# EasyEDA Pro project V2_compatibility_export_as_received.epro, board ESP32P4_Prototype_V2.3b6
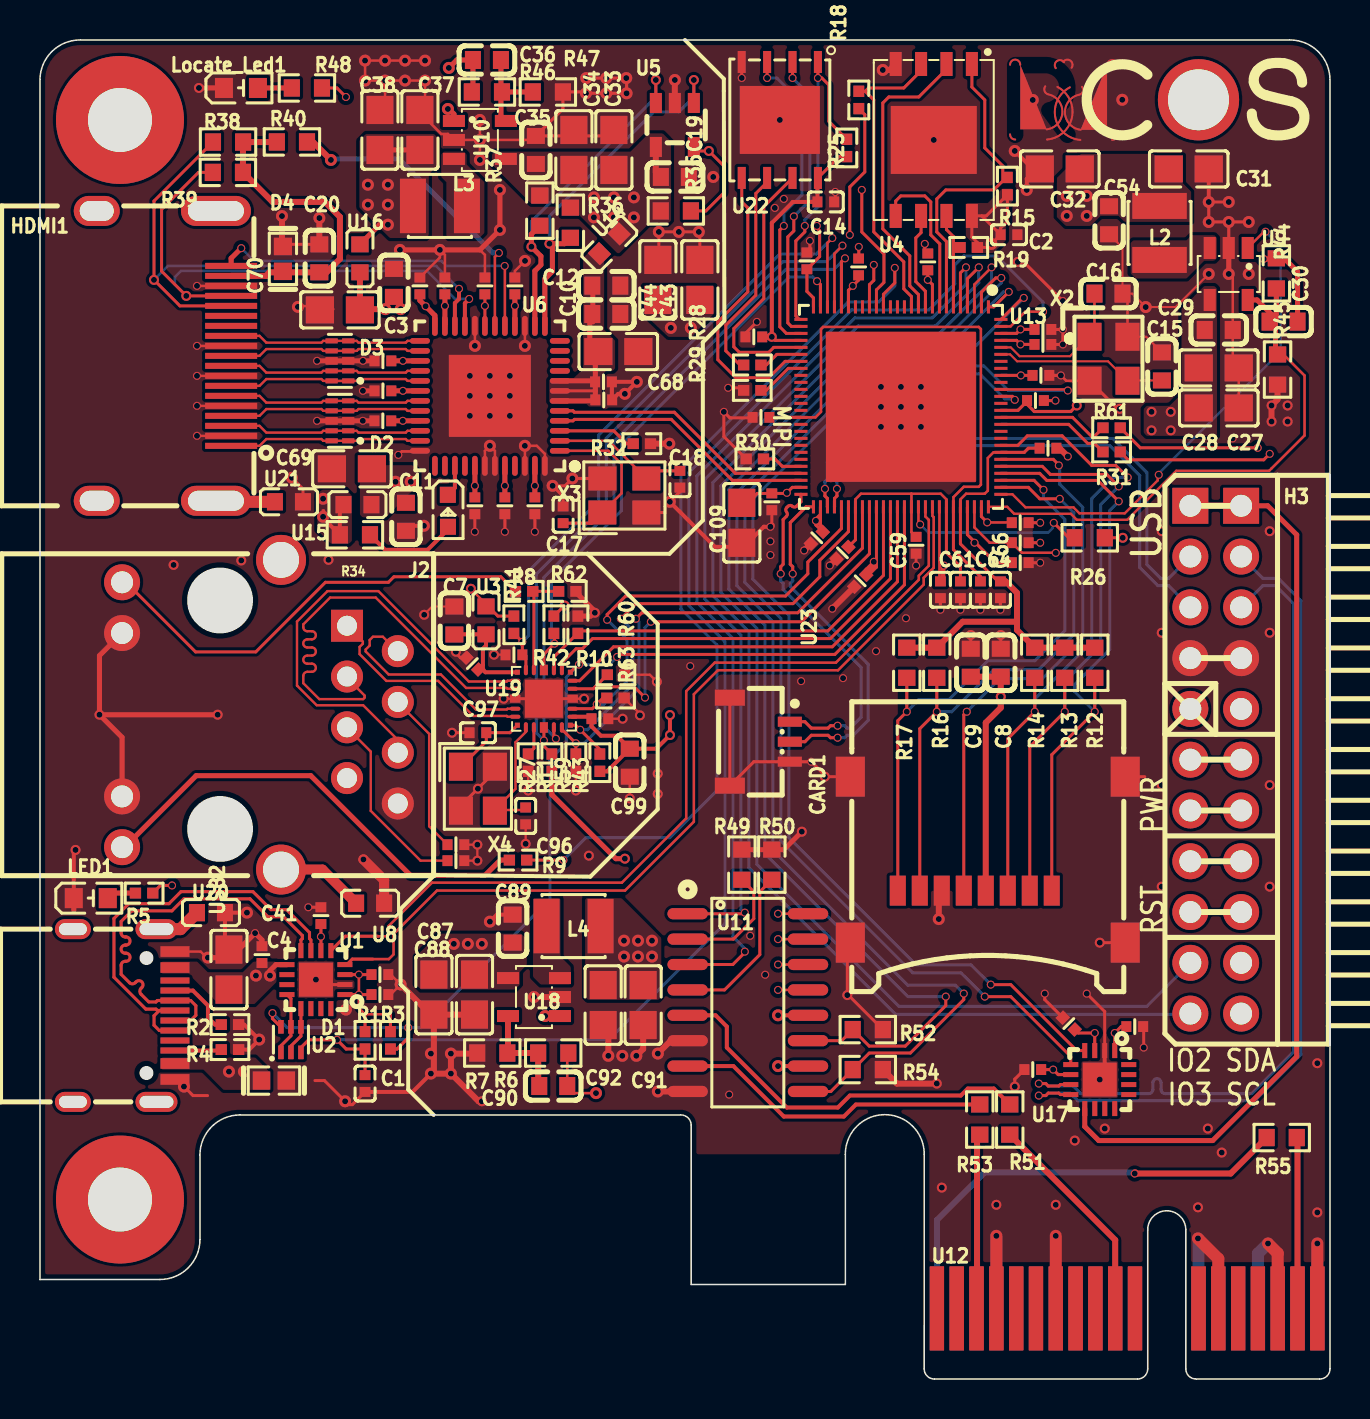
[diagram p8: board, top side]
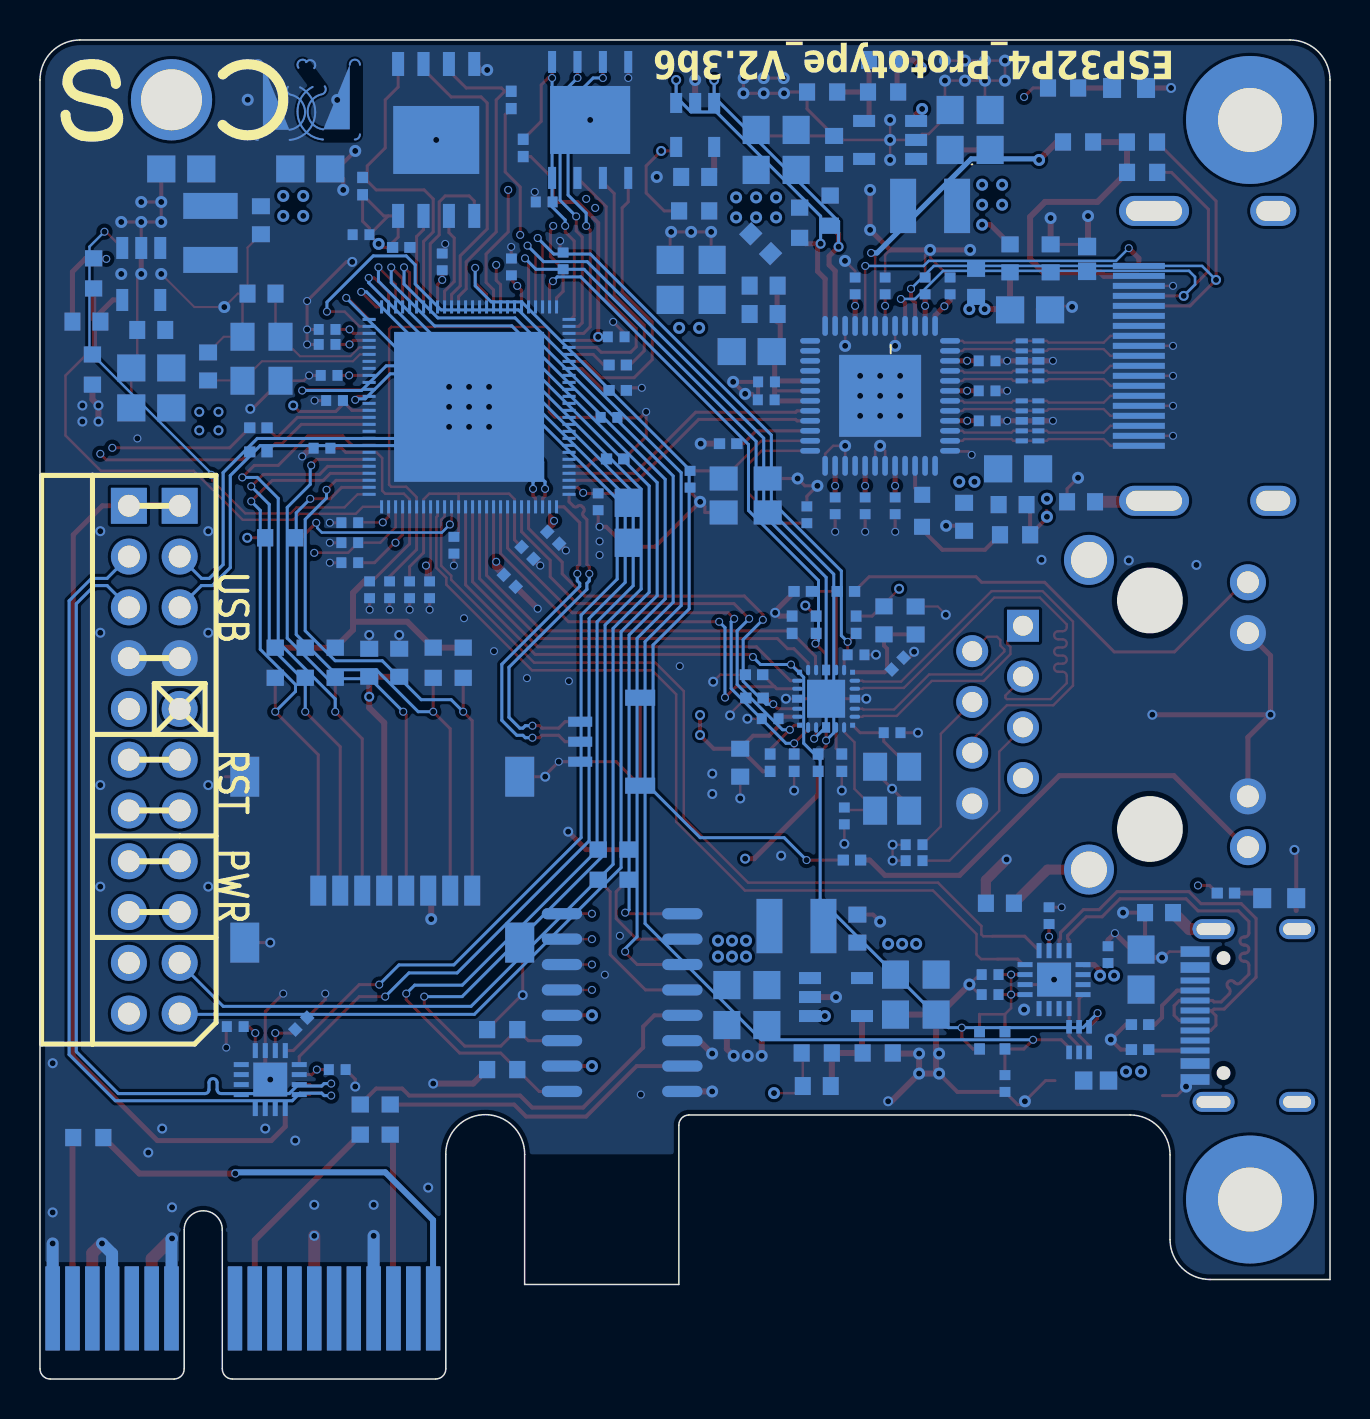
[diagram p9: board, bottom side, seen from below]

Outline 64.52 x 66.98 mm; copper layers: Top Layer, GND, VCC, VCC1, GND1, Bottom Layer. Coordinates in mm from the lower left corner of the outline.
Outline path: 0,64.98 arc(0.59,66.39) 2,66.98 62.52,66.98 arc(63.93,66.39) 64.52,64.98 64.52,0.51 arc(64.37,0.15) 64.01,0 57.81,0 arc(57.45,0.15) 57.3,0.51 57.3,7.46 arc(56.35,8.41) 55.4,7.46 55.4,0.51 arc(55.25,0.15) 54.89,0 44.73,0 arc(44.37,0.15) 44.22,0.51 44.22,11.24 arc(42.25,13.21) 40.28,11.24 40.28,4.73 32.57,4.73 32.57,12.7 arc(32.42,13.06) 32.06,13.21 10,13.21 arc(8.59,12.62) 8,11.21 8,6.98 arc(7.41,5.56) 6,4.98 0,4.98 0,64.98
Stack: Top Layer 0.035mm Outer layer thickness 1oz / Dielectric1 0.0994mm 3313 RC57% 4.2mil / GND 0.035mm / Dielectric2 0.55mm 0.55mm H/H No copper / VCC 0.035mm / Dielectric3 0.1088mm 2116 RC54% 4.9mil / VCC1 0.0152mm Inner layer thickness / Dielectric4 0.55mm 0.55mm H/H No copper / GND1 0.0152mm Inner layer thickness / Dielectric5 0.0994mm 3313 RC57% 4.2mil / Bottom Layer 0.035mm Outer layer thickness 1oz

## Design rules (mm)
net HDMI_2P+: DP4
net HDMI_2N-: DP4
net HDMI_1P+: DP3
net HDMI_1N-: DP3
net HDMI_0P+: DP2
net HDMI_0N-: DP2
net HDMI_CP+: DP1
net HDMI_CN-: DP1
net REFCLK+: DP22
net REFCLK-: DP22
net PERN0: DP20
net PERP0: DP20
net PETP0: DP23
net PETN0: DP23
net CH343P0_USB_D+: DP16
net CH343P0_USB_D-: DP16
net DM_MS: DP17
net DP_MS: DP17
net TD+: DP26
net TD-: DP26
net RD+: DP25
net RD-: DP25
net DM_HID: DP18
net DP_HID: DP18
net USB2_D+: DP24
net USB2_D-: DP24
net USB1P1_N0: DP27
net USB1P1_P0: DP27
spacing copperThickness1oz (default): track to track 0.102, other pairs 0.102 to 0.3
spacing copperThickness2oz: track to track 0.203, other pairs 0.152 to 0.3
spacing copperThicknessInner0.5oz: track to track 0.089, other pairs 0.152 to 0.3
spacing Plane_innerPlane: track to track 0.102, other pairs 0.152 to 0.3
spacing Copper_1: track to track 0.102, other pairs 0.152 to 0.3
spacing Copper_copperRegion: track to track 0.102, other pairs 0.152 to 0.3
track width copperThickness1oz (default): min 0.102, default 0.254, max 2.54
track width copperThickness2oz: min 0.203, default 0.254, max 2.54
track width copperThickness0.5oz: min 0.089, default 0.254, max 2.54
differential pair differentialPair (default): width min 0.102, default 0.119, max 0.254; gap min 0.152, default 0.203
net GND uses copperRegion
net 5V_SYS uses copperRegion
net 3V3_SYS uses copperRegion
net USB3V3_MS uses copperRegion
net VCC_HP uses copperRegion
net P4_VDDO4_SDIO uses copperRegion
net $6N85 uses copperRegion

## Placement (name value [footprint] x y rotation side)
C1  1uF  [C0402]  16.26 14.78 90 top
C2  100nF  [C0402]  48.46 57.24 0 top
C3  10uf  [C0603]  17.7 54.83 270 top
C4  4.7uF  [C0805]  9.45 20.48 90 top
C5  100nF  [C0402 去耦电容]  20.8 25.93 180 top
C6  100nF  [C0402 去耦电容]  20.8 26.73 180 top
C7  1uF  [C0603]  20.72 37.94 270 top
C8  100nF  [C0603]  48.05 35.83 270 top
C9  10uF  [C0603]  46.55 35.83 270 top
C10  10uf  [C0603]  28.32 53.27 180 top
C11  10uf  [C0603]  18.3 43.13 90 top
C12  10uf  [C0603]  28.32 54.69 180 top
C14  100nF  [C0402]  39.3 58.88 0 top
C15  20pF  [C0603]  56.11 50.65 90 top
C16  20pF  [C0603]  53.44 54.29 180 top
C17  12pF  [C0402]  26.16 43.23 90 top
C18  12pF  [C0402]  32 45.01 270 top
C19  100nF  [C0603]  31.75 60.13 180 top
C20  100nF  [C0603]  13.97 56.06 270 top
C27  22uF  [C0805]  58.95 48.57 180 top
C28  22uF  [C0805]  58.95 50.57 180 top
C29  100nF  [C0603]  58.95 52.47 180 top
C30  22pF  [C0603]  62.19 52.89 0 top
C31  10uF  [C0805]  57.45 60.53 180 top
C32  10uF  [C0805]  51 60.53 0 top
C33  22uF  [C0805]  28.7 61.48 270 top
C34  22uF  [C0805]  26.7 61.48 270 top
C35  100nF  [C0603]  24.8 61.48 270 top
C36  22pF  [C0603]  22.35 65.98 180 top
C37  10uF  [C0805]  19 62.48 270 top
C38  10uF  [C0805]  17 62.48 270 top
C39  100nF  [C0402 去耦电容]  14.05 23.18 270 top
C40  100nF  [C0402 去耦电容]  17 20.23 180 top
C41  100nF  [C0402 去耦电容]  11.1 21.23 270 top
C42  100nF  [C0402 去耦电容]  17 19.23 180 top
C43  10uF  [C0805]  33 54.98 270 top
C44  10uF  [C0805]  30.9 54.98 270 top
C45  100nF  [C0402 去耦电容]  40.94 55.63 270 top
C46  100nF  [C0402 去耦电容]  44.4 55.88 270 top
C47  100nF  [C0402 去耦电容]  50.16 52.5 180 top
C48  100nF  [C0402 去耦电容]  49.02 42.83 180 top
C49  100nF  [C0402 去耦电容]  50.16 51.75 180 top
C50  100nF  [C0402 去耦电容]  50.06 50.2 180 top
C51  100nF  [C0402 去耦电容]  49.02 40.83 180 top
C52  100nF  [C0402 去耦电容]  41.02 39.93 45 top
C53  100nF  [C0402 去耦电容]  36.6 43.88 90 top
C54  10uF  [C0603]  53.47 57.96 90 top
C55  100nF  [C0402 去耦电容]  49.02 41.83 180 top
C56  100nF  [C0402 去耦电容]  49.78 48.94 180 top
C57  100nF  [C0402 去耦电容]  38.35 55.93 270 top
C58  100nF  [C0402 去耦电容]  38.85 42.08 45 top
C59  1uF  [C0402]  45.03 39.48 90 top
C60  100nF  [C0402 去耦电容]  35.7 52.13 0 top
C61  1uF  [C0402]  46.03 39.48 90 top
C62  100nF  [C0402 去耦电容]  40.13 41.32 45 top
C63  100nF  [C0402 去耦电容]  43.82 41.7 90 top
C64  1uF  [C0402]  47.03 39.48 90 top
C65  100nF  [C0402 去耦电容]  36.06 48.1 0 top
C66  10uF  [C0402]  48.03 39.48 90 top
C67  100nF  [C0402 去耦电容]  50.41 46.56 180 top
C68  22uF  [C0805]  28.92 51.39 180 top
C69  22uF  [C0805]  15.6 45.53 0 top
C70  22uF  [C0805]  15 53.48 0 top
C71  100nF  [C0402 去耦电容]  28.19 48.98 180 top
C72  100nF  [C0402 去耦电容]  28.18 49.88 180 top
C73  100nF  [C0402 去耦电容]  17.14 47.93 0 top
C74  100nF  [C0402 去耦电容]  17.15 50.93 0 top
C75  100nF  [C0402 去耦电容]  21.75 43.68 90 top
C76  100nF  [C0402 去耦电容]  22.25 54.68 270 top
C77  100nF  [C0402 去耦电容]  19 54.68 270 top
C78  100nF  [C0402 去耦电容]  17.15 49.43 0 top
C79  100nF  [C0402 去耦电容]  24.75 43.68 90 top
C80  100nF  [C0402 去耦电容]  23.25 43.68 90 top
C81  100nF  [C0402 去耦电容]  23.75 54.68 270 top
C82  100nF  [C0402 去耦电容]  20.25 54.68 270 top
C84  100nF  [C0402 去耦电容]  51.45 17.78 315 top
C85  100nF  [C0402 去耦电容]  49.65 15.48 0 top
C86  100nF  [C0402 去耦电容]  54.75 17.63 180 top
C87  4.7uF  [C0805]  19.7 19.23 90 top
C88  2.2uF  [C0805]  21.73 19.23 90 top
C89  100nF  [C0603]  23.64 22.53 270 top
C90  22pF  [C0603]  25.67 14.65 0 top
C91  10uF  [C0805]  28.17 18.7 90 top
C92  10uF  [C0805]  30.17 18.7 90 top
C96  18pF  [C0402]  24.29 28.17 270 top
C97  18pF  [C0402]  21.9 32.33 0 top
C98  100nF  [C0402 去耦电容]  23.7 36.22 0 top
C99  1uF  [C0603]  29.5 30.83 90 top
C100  100nF  [C0402 去耦电容]  21.62 35.79 315 top
C101  100nF  [C0402 去耦电容]  28 33.03 180 top
C109  10uF  [C0805]  35.1 42.83 90 top
CARD1  XKTF-1307-18  [TF-SMD_XKTF-1307-18]  47.4 25.98 0 top
D1  SLPESD0603M05  [D0603-BI]  11.7 14.93 180 top
D2  TPD4E05U06DQAR  [USON-10_L2.5-W1.0-P0.50-BL]  15 47.93 90 top
D3  TPD4E05U06DQAR  [USON-10_L2.5-W1.0-P0.50-BL]  15 50.93 90 top
D4  EZAEG3A50AV  [D0603-BI]  12.15 56.03 270 top
H3  X6521WR-2x11H-C60D30  [HDR-TH_22P-P2.54-H-M-R2-C11-S2.54]  58.8 30.98 90 top
HDMI1  HDMI-001S  [HDMI-SMD_HDMI-001S]  6.2 51.18 270 top
J2  HR911105A  [RJ45-TH_HR911105A]  11 33.23 270 top
L2  2.2uH  [IND-SMD_L3.0-W3.0_FNR30XXS]  55.99 57.33 270 top
L3  2.2uH  [IND-SMD_L3.0-W3.0_FNR30XXS]  20 58.68 0 top
L4  2.2uH  [IND-SMD_L3.0-W3.0_FNR30XXS]  26.68 22.66 180 top
LED1  GL0603UR01  [LED0603-FD]  2.54 24.05 180 top
Locate_Led1  GL0603UR01  [LED0603-FD]  10.05 64.58 180 top
MS_LED1  NCD0603R1  [LED0603-RD_RED]  20.4 43.43 270 top
NOREF  -  [Pad_e360]  57.94 63.99 0 top
NOREF#2  -  [Pad_e359]  4 62.98 0 top
NOREF#3  -  [Pad_e1577]  51.2 63.98 180 top
NOREF#4  -  [Pad_e358]  4 8.98 0 top
NOREF#5  -  [Pad_e1025]  51.2 64 0 top
R1  10kΩ  [R0402]  16.26 16.94 270 top
R2  5.1kΩ  [R0402]  9.5 17.73 180 top
R3  10kΩ  [R0402]  17.53 16.94 270 top
R4  5.1kΩ  [R0402]  9.5 16.48 180 top
R5  4.7k  [R0402]  5.21 24.31 180 top
R6  453kΩ  [R0603]  25.67 16.31 0 top
R7  100kΩ  [R0603]  22.62 16.31 0 top
R8  2.2K  [R0402]  24.21 39.4 180 top
R9  2.2K  [R0402]  23.91 25.96 180 top
R10  2.49kΩ  [R0402]  26.9 37.73 90 top
R11  2.2kΩ  [R0402]  25.6 30.83 270 top
R12  10kΩ  [R0603]  52.75 35.83 270 top
R13  10kΩ  [R0603]  51.25 35.83 270 top
R14  10kΩ  [R0603]  49.75 35.83 270 top
R15  10kΩ  [R0402]  48.38 59.67 90 top
R16  10kΩ  [R0603]  44.85 35.83 270 top
R17  10kΩ  [R0603]  43.35 35.83 270 top
R18  10kΩ  [R0402]  40.95 63.98 90 top
R19  10kΩ  [R0402]  46.45 56.6 0 top
R25  10kΩ  [R0402]  40.35 61.58 90 top
R26  10kΩ  [R0603]  52.5 42.08 0 top
R27  6.49kΩ  [R0402]  24.42 30.83 270 top
R28  22Ω  [R0402]  35.62 50.72 0 top
R29  4.02kΩ  [R0402]  35.62 49.45 0 top
R30  4.02kΩ  [R0402]  35.75 46.02 0 top
R31  0R  [R0402]  53.59 46.37 180 top
R32  4.7kΩ  [R0402]  30.1 46.78 180 top
R34  2.2k  [R0603]  15.75 42.23 180 top
R35  4.7kΩ  [R0603]  31.8 58.43 180 top
R36  4.7kΩ  [R0603]  26.52 57.84 90 top
R37  4.7kΩ  [R0603]  25 58.44 90 top
R38  47kΩ  [R0603]  9.4 61.87 180 top
R39  47kΩ  [R0603]  9.4 60.35 180 top
R40  1kΩ  [R0603]  12.6 61.88 0 top
R41  10kΩ  [R0402]  23.7 37.73 90 top
R42  10kΩ  [R0402]  25.7 37.73 90 top
R43  2.49kΩ  [R0402]  28 30.83 270 top
R44  499kΩ  [R0603]  61.83 55.3 90 top
R45  499kΩ  [R0603]  61.89 50.49 90 top
R46  499kΩ  [R0603]  22.35 64.38 180 top
R47  499kΩ  [R0603]  25.4 64.38 180 top
R48  1kΩ  [R0603]  13.35 64.58 180 top
R49  470Ω  [R0603]  35.1 25.73 270 top
R50  470Ω  [R0603]  36.6 25.73 270 top
R51  470Ω  [R0603]  48.5 12.98 270 top
R52  10kΩ  [R0603]  41.4 17.48 180 top
R53  2.2kΩ  [R0603]  47 12.98 270 top
R54  10kΩ  [R0603]  41.4 15.48 180 top
R55  0  [R0603]  62.1 12.08 0 top
R59  2.49kΩ  [R0402]  26.8 30.83 270 top
R60  2.49kΩ  [R0402]  28.81 35.23 0 top
R61  0R  [R0402]  53.59 47.58 180 top
R62  2.49kΩ  [R0402]  26.37 39.4 0 top
R63  2.49kΩ  [R0402]  28.78 34.06 0 top
U1  CH343P  [TQFN-16_L3.0-W3.0-P0.50-BL-EP1.7]  13.8 19.98 90 top
U2  EMH4T2R  [SOT-563-6_L1.6-W1.2-P0.50-LS1.6-BL]  12.55 16.98 0 top
U3  BLM18PG121SN1D  [L0603]  22.31 37.95 90 top
U4  GD5F2GQ5UEYIGR  [WSON-8_L6.0-W8.0-P1.27-BL-EP]  44.7 61.98 180 top
U5  AT24C16C-STUM-T  [SOT-23-5_L2.9-W1.6-P0.95-LS2.8-BL]  31.75 62.73 180 top
U6  MS2109  [QFN-48_L7.0-W7.0-P0.50-TL-EP4.1]  22.5 49.18 180 top
U8  BLM18PG121SN1D  [L0603]  16.51 23.8 180 top
U9  TLV62569DBVR  [SOT-23-5_L3.0-W1.7-P0.95-LS2.8-BR]  59.45 55.27 90 top
U10  TLV62569DBVR  [SOT-23-5_L3.0-W1.7-P0.95-LS2.8-BR]  22 61.98 180 top
U11  AQS221R2S  [SO-16_L10.3-W4.4-P1.27-LS7.0-BL]  35.4 18.83 270 top
U12  -  [PCIe*1 key]  44.86 3.53 0 top
U13  ESP32-P4NRW32X  [QFN-104_L10.0-W10.0-P0.35-TL-EP7.5]  43.06 48.63 270 top
U14  BLM18PG121SN1D  [L0603]  28.47 56.79 225 top
U15  BLM18PG121SN1D  [L0603]  15.88 43.74 0 top
U16  BLM18PG121SN1D  [L0603]  16 56.06 270 top
U17  CH343P  [TQFN-16_L3.0-W3.0-P0.50-BL-EP1.7]  53 14.98 180 top
U18  TLV62569DBVR  [SOT-23-5_L3.0-W1.7-P0.95-LS2.8-BR]  24.7 19.11 0 top
U19  DP83825IRMQR  [HVQFN-24_L3.0-W3.0-P0.40-TL-EP1.9]  25.2 34.03 270 top
U20  BLM18PG121SN1D  [L0603]  8.55 23.33 180 top
U21  BLM18PG121SN1D  [L0603]  12.45 43.88 180 top
U22  GD25Q128EWIGR  [WSON-8_L6.0-W5.0-P1.27-TL-EP]  37 62.98 270 top
U23  ZX-SH1.0-3PLT  [CONN-SMD_3P-P1.00_HDGC_HDGC1002WV-S-3P]  36 31.88 270 top
USB2  HX TYPE-C 16P L8.35  [USB-C-SMD_HX-TYPE-C-16P-L8.35]  4.2 18.18 270 top
X2  40MHz  [OSC-SMD_4P-L3.2-W2.5-BL_SIT8008BI]  53.44 51.03 270 top
X3  24MHz  [CRYSTAL-SMD_4P-L3.2-W2.5-BL]  29.22 44.19 0 top
X4  25MHz  [CRYSTAL-SMD_4P-L3.2-W2.5-BL]  21.9 29.53 270 top

## Footprints (pads in the part's own frame, mm; a bottom-side part is the same pattern mirrored in y, then rotated)
C0402
  rect 0.5x0.54 hole 0.001: 1(-0.42,0) 2(0.42,0)
C0402 去耦电容
  rect 0.5x0.54 hole 0.001: 1(-0.42,0) 2(0.42,0)
C0603
  rect 0.8x0.9 hole 0.001: 1(-0.7,0) 2(0.7,0)
C0805
  rect 1.41x1.35 hole 0.001: 1(-1,0) 2(1,0)
CONN-SMD_3P-P1.00_HDGC_HDGC1002WV-S-3P
  rect 0.5x1.2 hole 0.001: 1(-1,1.5) 2(0,1.5) 3(1,1.5)
  rect 0.8x1.5 hole 0.001: 4(2.2,-1.5) 5(-2.2,-1.5)
CRYSTAL-SMD_4P-L3.2-W2.5-BL
  rect 1.4x1.2 hole 0.001: 1(-1.1,-0.85) 2(1.1,-0.85) 3(1.1,0.85) 4(-1.1,0.85)
D0603-BI
  rect 0.873x0.907 hole 0.001: 1(-0.622,0) 2(0.622,0)
HDMI-SMD_HDMI-001S
  rect 0.3x2.6 hole 0.001: 1(4.5,3.36) 2(4,3.36) 3(3.5,3.36) 4(3,3.36) 5(2.5,3.36) 6(2,3.36) 7(1.5,3.36) 8(1,3.36) 9(0.5,3.36) 10(0,3.36) 11(-0.5,3.36) 12(-1,3.36) 13(-1.5,3.36) 14(-2,3.36) 15(-2.5,3.36) 16(-3,3.36) 17(-3.5,3.36) 18(-4,3.36) 19(-4.5,3.36)
  oval 1.5x3.5 hole 1x2.8: 20(-7.25,2.6) 21(7.25,2.6)
  oval 1.5x2.3 hole 1x1.7: 22(-7.25,-3.36) 23(7.25,-3.36)
HDR-TH_22P-P2.54-H-M-R2-C11-S2.54
  round 1.8 hole 1.1: 1(-12.7,-1.27) 2(-12.7,1.27) 3(-10.16,-1.27) 4(-10.16,1.27) 5(-7.62,-1.27) 6(-7.62,1.27) 7(-5.08,-1.27) 8(-5.08,1.27) 9(-2.54,-1.27) 10(-2.54,1.27) 11(0,-1.27) 12(0,1.27) 13(2.54,-1.27) 14(2.54,1.27) 15(5.08,-1.27) 16(5.08,1.27) 17(7.62,-1.27) 18(7.62,1.27) 19(10.16,-1.27) 20(10.16,1.27)
  rect 1.8x1.8 hole 1.1: 21(12.7,-1.27) 22(12.7,1.27)
HVQFN-24_L3.0-W3.0-P0.40-TL-EP1.9
  oval 0.525x0.2 hole 0.001: 1(-1.438,0.9) 2(-1.438,0.5) 4(-1.438,-0.5) 5(-1.438,-0.9) 13(1.438,-0.9) 14(1.438,-0.5) 16(1.438,0.5) 17(1.438,0.9)
  rect 0.525x0.4 hole 0.001: 3(-1.438,0) 15(1.438,0)
  rect 0.25x0.25 hole 0.001: 6(-1.325,-1.325) 12(1.325,-1.325) 18(1.325,1.325) 24(-1.325,1.325)
  oval 0.2x0.525 hole 0.001: 7(-0.9,-1.438) 8(-0.5,-1.438) 10(0.5,-1.438) 11(0.9,-1.438) 19(0.9,1.438) 20(0.5,1.438) 22(-0.5,1.438) 23(-0.9,1.438)
  rect 0.4x0.525 hole 0.001: 9(0,-1.438) 21(0,1.438)
  rect 1.9x1.9 hole 0.001: 25(0,0)
IND-SMD_L3.0-W3.0_FNR30XXS
  rect 1.3x2.72 hole 0.001: 1(1.35,0) 2(-1.35,0)
L0603
  rect 0.8x0.864 hole 0.001: 1(-0.7,0) 2(0.7,0)
LED0603-FD
  rect 0.9x1 hole 0.001: 1(-0.85,0) 2(0.85,0)
LED0603-RD_RED
  rect 0.8x0.8 hole 0.001: 1(-0.799,-0.004) 2(0.799,0.004)
OSC-SMD_4P-L3.2-W2.5-BL_SIT8008BI
  rect 1.4x1.2 hole 0.001: 1(-1.1,-0.95) 2(1.1,-0.95) 3(1.1,0.95) 4(-1.1,0.95)
Pad_e358
  round 6.4 hole 3.2: 1(0,0)
Pad_e359
  round 6.4 hole 3.2: 2(0,0)
Pad_e360
  round 4.064 hole 3.048: 1(0,0)
Pad_e1025
  custom 3.124x3.997 hole 0.001: 2(0,0)
Pad_e1577
  custom 3.124x3.996 hole 0.001: 2(0,0)
PCIe*1 key
  custom 0.711x4.191 hole 0.001: A1(0,0) A2(0.991,0) A5(3.962,0) A6(4.953,0) A7(5.944,0) A10(8.915,0) A12(13.081,0) A13(14.072,0) A16(17.044,0) A17(18.034,0) A18(19.024,0) B1(0,0) B2(0.991,0) B5(3.962,0) B6(4.953,0) B7(5.944,0) B10(8.915,0) B12(13.081,0) B13(14.072,0) B16(17.044,0) B17(18.034,0) B18(19.024,0)
  custom 0.712x4.191 hole 0.001: A3(1.981,0) A4(2.972,0) A8(6.934,0) A9(7.925,0) A14(15.062,0) A15(16.053,0) B3(1.981,0) B4(2.972,0) B8(6.934,0) B9(7.925,0) B14(15.062,0) B15(16.053,0)
  rect 0.711x4.191 hole 0.001: A11(9.906,0) B11(9.906,0)
QFN-48_L7.0-W7.0-P0.50-TL-EP4.1
  oval 1x0.28 hole 0.001: 1(-3.5,2.75) 2(-3.5,2.25) 3(-3.5,1.75) 4(-3.5,1.25) 5(-3.5,0.75) 6(-3.5,0.25) 7(-3.5,-0.25) 8(-3.5,-0.75) 9(-3.5,-1.25) 10(-3.5,-1.75) 11(-3.5,-2.25) 12(-3.5,-2.75) 25(3.5,-2.75) 26(3.5,-2.25) 27(3.5,-1.75) 28(3.5,-1.25) 29(3.5,-0.75) 30(3.5,-0.25) 31(3.5,0.25) 32(3.5,0.75) 33(3.5,1.25) 34(3.5,1.75) 35(3.5,2.25) 36(3.5,2.75)
  oval 0.28x1 hole 0.001: 13(-2.75,-3.5) 14(-2.25,-3.5) 15(-1.75,-3.5) 16(-1.25,-3.5) 17(-0.75,-3.5) 18(-0.25,-3.5) 19(0.25,-3.5) 20(0.75,-3.5) 21(1.25,-3.5) 22(1.75,-3.5) 23(2.25,-3.5) 24(2.75,-3.5) 37(2.75,3.5) 38(2.25,3.5) 39(1.75,3.5) 40(1.25,3.5) 41(0.75,3.5) 42(0.25,3.5) 43(-0.25,3.5) 44(-0.75,3.5) 45(-1.25,3.5) 46(-1.75,3.5) 47(-2.25,3.5) 48(-2.75,3.5)
  rect 4.1x4.1 hole 0.001: 49(0,0)
QFN-104_L10.0-W10.0-P0.35-TL-EP7.5
  rect 0.65x0.15 hole 0.001: 1(-5,4.375) 2(-5,4.025) 3(-5,3.675) 4(-5,3.325) 5(-5,2.975) 6(-5,2.625) 7(-5,2.275) 8(-5,1.925) 9(-5,1.575) 10(-5,1.225) 11(-5,0.875) 12(-5,0.525) 13(-5,0.175) 14(-5,-0.175) 15(-5,-0.525) 16(-5,-0.875) 17(-5,-1.225) 18(-5,-1.575) 19(-5,-1.925) 20(-5,-2.275) 21(-5,-2.625) 22(-5,-2.975) 23(-5,-3.325) 24(-5,-3.675) 25(-5,-4.025) 26(-5,-4.375) 53(5,-4.375) 54(5,-4.025) 55(5,-3.675) 56(5,-3.325) 57(5,-2.975) 58(5,-2.625) 59(5,-2.275) 60(5,-1.925) 61(5,-1.575) 62(5,-1.225) 63(5,-0.875) 64(5,-0.525) 65(5,-0.175) 66(5,0.175) 67(5,0.525) 68(5,0.875) 69(5,1.225) 70(5,1.575) 71(5,1.925) 72(5,2.275) 73(5,2.625) 74(5,2.975) 75(5,3.325) 76(5,3.675) 77(5,4.025) 78(5,4.375)
  rect 0.15x0.65 hole 0.001: 27(-4.375,-5) 28(-4.025,-5) 29(-3.675,-5) 30(-3.325,-5) 31(-2.975,-5) 32(-2.625,-5) 33(-2.275,-5) 34(-1.925,-5) 35(-1.575,-5) 36(-1.225,-5) 37(-0.875,-5) 38(-0.525,-5) 39(-0.175,-5) 40(0.175,-5) 41(0.525,-5) 42(0.875,-5) 43(1.225,-5) 44(1.575,-5) 45(1.925,-5) 46(2.275,-5) 47(2.625,-5) 48(2.975,-5) 49(3.325,-5) 50(3.675,-5) 51(4.025,-5) 52(4.375,-5) 79(4.375,5) 80(4.025,5) 81(3.675,5) 82(3.325,5) 83(2.975,5) 84(2.625,5) 85(2.275,5) 86(1.925,5) 87(1.575,5) 88(1.225,5) 89(0.875,5) 90(0.525,5) 91(0.175,5) 92(-0.175,5) 93(-0.525,5) 94(-0.875,5) 95(-1.225,5) 96(-1.575,5) 97(-1.925,5) 98(-2.275,5) 99(-2.625,5) 100(-2.975,5) 101(-3.325,5) 102(-3.675,5) 103(-4.025,5) 104(-4.375,5)
  rect 7.5x7.5 hole 0.001: 105(0,0)
R0402
  rect 0.566x0.54 hole 0.001: 1(-0.433,0) 2(0.433,0)
R0603
  rect 0.806x0.864 hole 0.001: 1(-0.753,0) 2(0.753,0)
RJ45-TH_HR911105A
  rect 1.6x1.6 hole 1: 1(-4.45,4.355)
  round 1.6 hole 1: 2(-3.18,6.895) 3(-1.91,4.355) 4(-0.64,6.895) 5(0.63,4.355) 6(1.9,6.895) 7(3.17,4.355) 8(4.44,6.895)
  round 1.8 hole 1.1: 9(-6.625,-6.895) 10(-4.085,-6.895) 11(4.085,-6.895) 12(6.625,-6.895)
  round 2.5 hole 1.8: SH1(-7.745,1.055) SH2(7.745,1.055)
SO-16_L10.3-W4.4-P1.27-LS7.0-BL
  oval 0.56x2.02 hole 0.001: 1(-4.445,-3.01) 2(-3.175,-3.01) 3(-1.905,-3.01) 4(-0.635,-3.01) 5(0.635,-3.01) 6(1.905,-3.01) 7(3.175,-3.01) 8(4.445,-3.01) 9(4.445,3.01) 10(3.175,3.01) 11(1.905,3.01) 12(0.635,3.01) 13(-0.635,3.01) 14(-1.905,3.01) 15(-3.175,3.01) 16(-4.445,3.01)
SOT-23-5_L2.9-W1.6-P0.95-LS2.8-BL
  rect 0.6x1 hole 0.001: 1(-0.95,-1.1) 2(0,-1.1) 3(0.95,-1.1) 4(0.95,1.1) 5(-0.95,1.1)
SOT-23-5_L3.0-W1.7-P0.95-LS2.8-BR
  rect 1.1x0.6 hole 0.001: 1(1.3,-0.95) 2(1.3,0) 3(1.3,0.95) 4(-1.3,0.95) 5(-1.3,-0.95)
SOT-563-6_L1.6-W1.2-P0.50-LS1.6-BL
  rect 0.28x0.68 hole 0.001: 1(-0.5,-0.64) 2(0,-0.64) 3(0.5,-0.64) 4(0.5,0.64) 5(0,0.64) 6(-0.5,0.64)
TF-SMD_XKTF-1307-18
  rect 0.8x1.5 hole 0.001: 1(3.2,-1.55) 2(2.1,-1.55) 3(1,-1.55) 4(-0.1,-1.55) 5(-1.2,-1.55) 6(-2.3,-1.55) 7(-3.4,-1.55) 8(-4.5,-1.55)
  rect 1.45x2 hole 0.001: 9(-6.875,4.15) 10(-6.875,-4.15) 11(6.875,-4.15) 12(6.875,4.15)
TQFN-16_L3.0-W3.0-P0.50-BL-EP1.7
  rect 0.25x0.75 hole 0.001: 1(-0.749,-1.45) 2(-0.248,-1.45) 3(0.252,-1.45) 4(0.751,-1.45) 9(0.75,1.45) 10(0.25,1.45) 11(-0.25,1.45) 12(-0.749,1.45)
  rect 0.75x0.25 hole 0.001: 5(1.45,-0.75) 6(1.45,-0.25) 7(1.45,0.25) 8(1.45,0.75) 13(-1.45,0.75) 14(-1.45,0.25) 15(-1.45,-0.25) 16(-1.45,-0.75)
  rect 1.7x1.7 hole 0.001: 17(0.001,0)
USB-C-SMD_HX-TYPE-C-16P-L8.35
  oval 1x2.1 hole 0.6x1.7: 1(-4.32,1.627) 2(4.32,1.627)
  oval 1x1.8 hole 0.6x1.4: 3(-4.32,-2.553) 4(4.32,-2.553)
  rect 0.53x1.45 hole 0.001: A1B12(-3.2,2.553) A4B9(-2.4,2.553) B1A12(3.2,2.552) B4A9(2.4,2.553)
  rect 0.3x1.45 hole 0.001: A5(-1.25,2.553) A6(-0.25,2.553) A7(0.25,2.553) A8(1.25,2.553) B5(1.75,2.553) B6(0.75,2.553) B7(-0.75,2.553) B8(-1.75,2.553)
USON-10_L2.5-W1.0-P0.50-BL
  rect 0.25x0.609 hole 0.001: 1(-1,-0.414) 2(-0.5,-0.414) 4(0.5,-0.414) 5(1,-0.414) 6(1,0.414) 7(0.5,0.414) 9(-0.5,0.414) 10(-1,0.414)
  rect 0.38x0.609 hole 0.001: 3(0,-0.414) 8(0,0.414)
WSON-8_L6.0-W5.0-P1.27-TL-EP
  rect 1.1x0.4 hole 0.001: 1(-2.9,1.905) 2(-2.9,0.635) 3(-2.9,-0.635) 4(-2.9,-1.905) 5(2.9,-1.905) 6(2.9,-0.635) 7(2.9,0.635) 8(2.9,1.905)
  rect 3.4x4 hole 0.001: 9(0,0)
WSON-8_L6.0-W8.0-P1.27-BL-EP
  rect 0.6x1.2 hole 0.001: 1(-1.905,-3.8) 2(-0.635,-3.8) 3(0.635,-3.8) 4(1.905,-3.8) 5(1.905,3.8) 6(0.635,3.8) 7(-0.635,3.8) 8(-1.905,3.8)
  rect 4.3x3.4 hole 0.001: 9(0.001,0.001)

## Nets
As in the schematic, except:
3V3AUX: R51.2 U12.B10
GND: C1.1 C2.2 C3.1 C4.2 C5.1 C6.1 C7.1 C8.1 C9.1 C10.1 C11.1 C12.1 C14.2 C15.2 C16.1 C17.2 C18.2 C19.1 C20.1 C27.1 C28.1 C29.1 C31.1 C32.1 C33.1 C34.1 C35.1 C37.1 C38.1 C39.1 C40.1 C41.1 C42.1 C43.1 C44.1 C45.1 C46.1 C47.1 C48.1 C49.1 C50.1 C51.1 C52.1 C53.1 C54.1 C55.1 C56.1 C57.1 C58.1 C59.1 C60.1 C61.1 C62.1 C63.1 C64.1 C65.1 C66.1 C67.1 C68.1 C69.1 C70.1 C71.1 C72.1 C73.1 C74.1 C75.1 C76.1 C77.1 C78.1 C79.1 C80.1 C81.1 C82.1 C84.1 C85.1 C86.1 C87.1 C88.1 C89.1 C91.1 C92.1 C96.2 C97.1 C98.1 C99.1 C100.1 C101.1 C109.1 CARD1.6 CARD1.9 CARD1.10 CARD1.11 CARD1.12 D1.1 D2.3 D2.8 D3.3 D3.8 D4.1 H3.15 H3.16 HDMI1.2 HDMI1.5 HDMI1.8 HDMI1.11 HDMI1.17 J2.8 J2.10 J2.11 LED1.2 Locate_Led1.2 R2.1 R4.1 R7.1 R10.2 R27.2 R29.1 R30.1 R32.1 R45.1 R47.1 R49.1 R50.1 R52.1 R54.1 R59.2 R60.2 R62.2 R63.2 U1.2 U1.17 U4.4 U4.9 U5.2 U6.15 U6.20 U6.36 U6.42 U6.43 U6.46 U6.48 U6.49 U8.1 U9.2 U10.2 U11.6 U11.8 U12.A4 U12.A12 U12.A15 U12.A18 U12.B4 U12.B7 U12.B13 U12.B16 U12.B18 U13.105 U17.2 U17.17 U18.2 U19.9 U19.21 U19.25 U20.1 U21.1 U22.4 U22.9 U23.3 U23.4 U23.5 USB2.A1B12 USB2.B1A12 X2.2 X2.4 X3.2 X3.4 X4.2 X4.4

Pads without a net: H3 13 14; HDMI1 13 14; J2 7; NOREF 1; NOREF#2 2; NOREF#3 2; NOREF#4 1; NOREF#5 2; U1 10 11 14 15 16; U6 9 10 11 12 37 38 45; U12 A2 A3 A5 A6 A7 A8 A9 A10 B1 B2 B5 B6 B8 B9 B12; U13 13 14 15 20 35 36 37 38 39 40 42 43 44 45 46 47 95 97 98; U17 10 11 12 13 14 15 16; USB2 A8 B8

## Via types
v1: diameter 0.4, hole 0.3, Top Layer to Bottom Layer, 174 vias
v2: diameter 0.5, hole 0.3, Top Layer to Bottom Layer, 86 vias
v3: diameter 0.6, hole 0.3, Top Layer to Bottom Layer, 140 vias
v4: diameter 0.399, hole 0.299, Top Layer to Bottom Layer, 1 via

## Routing (per net, layer and track width the routed paths; a pad name or vN(x,y) marks a point on that pad's centre or on a via; arc(x,y) is an arc through that point)
1V2_SYS: length 17.1
  Top Layer w0.155: C76.2 v1(22.25,53.68) U6.19
  Top Layer w0.254: v3(20.45,65.58) 20.84,65.98 C36.2 21.65,64.43 R46.2 ; U6.41 v1(21.75,44.68) C75.2 ; v3(17.4,57.74) 16.98,57.74 U16.1 ; C37.2 C38.2
  VCC1 w0.254: v3(17.4,59.74) 17.4,61.9 20.45,64.95 v3(20.45,65.58)
  vias: v3(16.4,59.74) v3(16.4,58.74) v3(17.4,58.74)
3V3_SYS: length 182
  Top Layer w0.119: 22.27,38.8 21.61,39.45 21.61,39.55
  Top Layer w0.127: 17.53,18.24 16.26,18.24 15.95,18.55 v1(15.95,19.23) v1(15.95,20.23) ; R6.2 26.37,16.25 26.37,14.65 26.72,14.3 v3(27.81,14.3) ; 48.6,42.83 48.59,42.85 v1(47.37,42.85)
  Top Layer w0.15: v2(54.15,42.08) R26.2 ; v1(52.75,17.31) 51.92,17.31 C84.2 ; v1(53.75,17.31) 54.07,17.63 54.33,17.63 ; 47.1,58.18 U4.8 46.61,57.12 46.88,56.84 R19.2 47.4,56.6 C2.1 ; 47.1,58.18 C2.1 ; 47.1,58.18 47.32,58.18 48.38,59.24 48.38,57.91 48.04,57.57 C2.1 ; 48.6,40.83 47.78,40.83 46.38,42.23 U13.75 ; 26.18,38.64 R42.2 ; 35.4,43.83 35.87,44.3 C53.2 37.32,44.3 v1(37.35,44.33) 37.62,44.6 U13.51 ; v1(40.5,57.23) 40.5,59.63 41.25,60.38 41.25,63.24 R18.1 ; 41.45,40.23 41.83,40.61 U13.62 ; 44.4,55.46 v1(44.4,54.98) 44.63,54.75 U13.9 ; R41.2 22.9,38.16 22.31,38.75 ; v1(40.65,54.68) 40.94,54.97 40.94,55.21 ; U13.77 47.08,43.14 v1(47.37,42.85)
  Top Layer w0.155: U1.6 v1(14.05,22.13) 14.05,22.76 ; 16.26,18.24 16.26,17.61 ; v1(40.65,54.68) 40.43,54.46 U13.21 ; U13.101 48.84,51.95 v1(49.04,51.75) 49.71,51.75 ; U1.3 v1(15.95,20.23) 16.58,20.23 ; 49.71,52.5 v1(49.04,52.5) 48.84,52.3 U13.102 ; U1.1 v1(15.95,19.23) 16.58,19.23 ; U13.96 v1(49.06,50.2) 49.64,50.2 ; C85.2 v1(50.67,15.48) 50.92,15.23 51.55,15.23 ; 17.53,18.24 17.53,17.61 ; U17.1 v1(53.75,17.31) ; C52.2 41.32,40.5 v1(41.7,40.88) ; U17.3 v1(52.75,17.31)
  Top Layer w0.2: C99.2 28.36,30.39 R43.2 ; C99.2 30.82,31.53 v2(31.51,32.21) v2(31.51,33.21) ; C99.2 28.85,32.18 28.05,32.18 27.58,32.65 C101.2 27.48,33.13 U19.19 ; 14.17,43.42 14.17,43.05 R34.2 15,43.56 U15.1 ; U11.10 v3(36.91,15.65) ; v3(36.91,18.19) U11.12
  Top Layer w0.203: 41.39,40.36 41.68,40.65 41.74,40.65 ; 41.45,40.22 41.45,40.23
  Top Layer w0.254: C80.2 v1(23.25,44.68) U6.44 ; U6.23 v1(20.25,53.68) 20.25,54.26 ; R11.2 25.6,29.23 28.8,26.03 v2(29.25,26.03) ; 20.45,63.53 20.7,63.27 U10.1 ; U6.16 v1(23.75,53.68) C81.2
  Top Layer w0.3: U5.4 30.8,60.38 31.05,60.13 ; C9.2 C8.2 v2(48.05,34.13) 48.05,33.58 47.3,32.83 CARD1.4
  VCC w0.15: 23.46,54 20.45,57.02 20.45,63.53 ; 28.24,38.69 27.38,39.55 23.61,39.55
  VCC w0.155: 27.86,14.29 27.18,14.97 27.18,21 25.76,22.42 25.76,22.64 25.97,22.84 27.69,22.84
  VCC w0.2: 28.24,38.69 29.23,39.68 33.45,39.68 35.7,37.43 35.7,35.41 33.51,33.21 33.51,29.49 29.21,25.19 v3(29.21,21.93) v3(29.21,21.13) 27.49,22.84 26.26,24.08 19.5,24.08 15.95,20.53 v1(15.95,20.23)
  VCC w0.254: 31.51,32.21 33.5,32.21
  VCC w0.3: v3(47.58,56.78) 46.65,56.78 45.6,55.73 45.6,54.68 ; 43.35,54.53 43.35,56.18 42.3,57.23 v1(40.5,57.23)
  vias: v1(46.74,41.83) v2(21.55,39.53) v2(26.24,38.69) v2(55.59,48.38) v2(55.59,47.45) v2(56.55,48.38) v2(56.55,47.45) v3(14.16,44.03) v3(14.16,43.13) v3(20.4,63.53) v3(27.7,59.1) v3(27.7,58.1) v3(28.7,59.1) v3(28.7,58.1) v3(29.7,59.1) v3(29.7,58.1) v3(29.91,21.93) v3(29.91,21.13) v3(30.61,21.93) v3(30.61,21.13) v3(31.55,52.58) v3(32.55,52.58)
3V3AUX: length 10.9
  Top Layer w0.3: U12.B10 53.77,6.95 R51.2
5V_SYS: length 15
  Top Layer w0.155: v1(6.6,24.69) 6.02,24.69 R5.1
  Top Layer w0.254: v3(11.5,20.18) 11.5,20.43 11.8,20.73 U1.9
  VCC w0.15: 20.19,18.46 20.5,18.16 v3(25.26,18.16)
  VCC w0.155: 8.95,19.83 9.53,20.4 9.53,23.8 8.64,24.69 v1(6.6,24.69)
  vias: v3(9.45,15.38) v3(10.2,15.38) v3(10.8,20.18) v3(20.7,21.77) v3(21.4,21.77) v3(22.1,21.77)
12V_SYS: length 8.8
  Top Layer w0.3: R53.2 46.86,12.09 46.86,3.56 46.84,3.53
A1V2_MS: length 5.9
  Top Layer w0.254: v1(18.14,47.93) U6.33 ; 17.57,50.93 18.15,50.93 ; U6.27 18.15,50.93 ; 17.57,47.93 18.14,47.93
  Top Layer w0.3: U16.2 16,53.58 16.07,53.52 17.24,53.52
  vias: v1(18.15,50.93) v3(17.27,53.52) v3(18.04,53.52)
A3V3_DP83825I: length 5.5
  Top Layer w0.2: C100.2 22.15,35.72 ; 22.15,35.72 22.15,35.48 22.27,35.35 U19.6 ; 22.15,35.72 22.15,36.53 22.31,36.68 U3.1 20.73,37.25 C7.2
A3V3_MS: length 4.9
  Top Layer w0.254: 19,54.26 19,53.95 v1(19.29,53.66) 19.75,53.2 U6.24 ; U6.30 18.15,49.43 ; C79.2 v1(24.75,44.68) U6.47 ; 17.57,49.43 18.15,49.43
  vias: v1(18.15,49.43) v3(17.78,44.88) v3(18.54,44.88)
GND: length 337
  Top Layer w0.102: C7.1 19.61,38.64 19.15,38.18
  Top Layer w0.104: C54.1 54.14,56.59 54.14,54.29 54.63,54.29 v3(55.3,53.62) 56.8,53.62 v3(58.45,55.27) ; X2.4 55.32,52.13 C15.2
  Top Layer w0.119: v2(30.85,34.88) 30.5,35.23 R60.2 ; R27.2 v2(24.42,29.44) ; U19.21 v2(27.21,34.03) ; C98.1 23.28,36.23 v2(22.7,36.23) ; U19.9 v2(23.19,34.03) ; C5.1 v2(21.88,25.93) v2(21.88,26.73) C6.1 ; C101.1 v2(29.14,33.03) ; 24.29,27.74 24.29,26.71 ; v2(30,33.2) 30,33.28 29.22,34.06 ; C99.1 v2(29.5,29.04) ; R59.2 v2(26.8,29.44)
  Top Layer w0.124: v1(7.85,54.68) 9.76,54.68 ; v1(7.85,50.18) 9.76,50.18 ; v1(7.85,47.18) 9.76,47.18 ; 9.76,51.68 v1(7.85,51.68) ; 9.76,48.68 v1(7.85,48.68)
  Top Layer w0.127: v3(59.45,55.27) 59.65,55.07 C29.1 59.65,50.87 C28.1 C27.1 ; v3(22,61.98) v3(22,60.98) ; v3(22,61.98) 24.6,61.98 C35.1 ; v3(22,61.98) v3(22,62.98) ; v3(22,61.98) U10.2 20.4,62.28 20.07,62.28 19,63.34 C37.1 19.26,63.73 v3(19.26,64.95) v3(18.26,64.95) v3(17.26,64.95) ; C38.1 17.26,63.73 v3(17.26,64.95) ; C77.1 20,56.1 v3(20,56.48) 20.25,56.23 C82.1 ; v3(24.26,55.93) 23.75,55.42 C81.1 ; v3(17.26,64.95) v3(16.26,64.95) v3(16.26,65.95) v3(17.26,65.95) v3(18.26,65.95) v3(19.26,65.95) ; 8.4,21.02 8.04,21.38 6.38,21.38 ; 14.67,53.52 14.52,53.67 12.86,53.67 ; X2.2 51.32,49.93 v1(51.06,50.2) ; X2.4 54.39,54.04 54.14,54.29 ; U6.43 22.75,46.43 v3(22.5,46.68) 22.25,46.43 U6.42 ; C40.1 17.54,20.23 v3(18.03,19.73) 17.53,19.23 C42.1 ; v3(24.25,51.68) U6.15 ; C76.1 22.25,56.23 22,56.48 ; U6.46 v3(24.25,46.68) 24.85,46.68 25.25,46.28 U6.48 ; 7.25,14.68 6.95,14.98 6.38,14.98 ; U6.20 v3(21.75,51.68) ; 18.35,42.34 18.33,42.31
  Top Layer w0.137: v4(17.92,46.22) 18.09,46.4 18.99,46.4
  Top Layer w0.15: D4.1 12.26,56.76 C20.1 ; C43.1 33,57.33 v3(32.95,57.38) v3(31.95,57.38) v3(30.95,57.38) 30.95,56.03 C44.1 ; U19.9 U19.25 U19.21 ; C9.1 v2(46.55,37.22) ; v1(44.25,56.78) 44.25,56.45 C46.1 ; C86.1 55.2,17.6 v1(55.2,16.58) ; v3(7.2,14.63) 7.65,14.18 8.38,14.18 ; 20.74,36.37 21.02,36.08 C100.1 ; R30.1 34.2,47.14 v1(34.2,48.38) ; U17.2 53.25,18.38 v1(52.35,19.28) ; 22.75,30.63 22.75,30.38 v2(21.9,29.53) 21.05,28.68 X4.2 ; 40.38,21.83 v2(40.38,19.2) 40.43,19.2 R52.1 ; v2(39.25,30.13) 40.38,30.13 ; C60.1 35.28,52.31 v1(35.85,52.88) ; v3(15.26,13.89) 14.22,14.93 13.75,14.93 ; v1(50.25,19.28) 50.25,18.98 C84.1 ; v3(12.6,45.08) 13.15,44.53 U21.1 ; C63.1 43.82,40.69 ; v1(39.77,59.38) 39.77,58.93 39.72,58.88 ; 21.48,32.33 v2(20.61,32.33) ; v2(53,21.83) 54.13,21.83 ; C8.1 v2(48.05,37.22) ; 36.6,43.46 36.6,42.7 ; 55.25,30.13 54.13,30.13 ; U22.4 v1(35.1,65.08)
  Top Layer w0.155: C33.1 28.4,62.18 C35.1 26.15,63.53 R47.1 27.24,64.38 v3(27.3,64.31) v3(28.32,64.31) v3(29.34,64.31) 29.34,65.06 v3(29.32,65.07) v3(28.32,65.07) v3(27.32,65.07) ; v1(24.75,42.38) 24.75,42.38 C79.1 ; v2(48.9,55.88) 49.2,55.88 v1(51.16,53.92) v1(51.16,52.5) ; 49.23,15.48 48.75,15 v2(48.75,14.63) ; 21.75,43.26 21.75,42.38 v1(21.75,42.38) ; U1.17 14.05,19.73 U1.2 ; v3(59.45,57.87) v3(58.45,57.87) v3(58.45,58.87) v3(59.45,58.87) ; v3(59.45,57.87) 59.45,56.96 ; v3(59.45,57.87) v3(60.45,57.87) ; v1(23.25,42.38) 23.25,42.38 C80.1 ; 54.03,48.54 53.88,48.54 X2.2 ; v1(34.42,49.58) 35.08,49.58 35.2,49.45 ; 49.44,41.83 v1(50.02,41.83) ; C18.2 32,44.38 v3(31.5,43.88) 31.27,43.64 31.27,43.34 X3.2 ; 15.37,13.73 15.62,13.73 C1.1 ; 47.03,39.06 v1(47.03,38.48) ; H3.16 H3.15 ; v1(13.42,23.6) C39.1 ; 50.48,50.2 v1(51.06,50.2) ; 46.03,39.06 v1(46.03,38.48) ; C17.2 26.16,44.15 v3(25.64,44.68) 26.26,44.68 v3(26.62,45.04) X3.4 ; 34.5,34.08 U23.4 35.7,30.88 U23.3 v1(38.57,30.88) 39.25,30.2 v2(39.25,30.13) ; C57.1 38.5,56.5 v1(38.5,56.93) ; v1(51.16,52.5) v1(51.16,51.75) 50.58,51.75 ; v1(51.16,52.5) 50.58,52.5 ; 50.2,48.94 v1(50.78,48.94) ; 49.44,42.83 v1(50.02,42.83) ; 48.03,39.06 v1(48.03,38.48) ; 49.44,40.83 v1(50.02,40.83) ; C45.1 40.95,56.06 v1(40.95,56.63) ; v1(34.2,48.38) 34.5,48.08 35.61,48.08 35.64,48.1 ; 45.03,39.06 v1(45.03,38.48)
  Top Layer w0.2: 9.42,21.51 9.25,21.68 U20.1 v3(10.35,23.33) ; C89.1 22.85,23.23 v3(22.5,22.88) ; v2(1.78,26.46) 1.69,26.38 1.69,24.05 ; v3(31.5,43.88) 33.75,41.63 35.4,41.63 35.4,41.83 36.2,42.63 v1(36.53,42.63) ; v3(19.2,42.68) 18.69,42.68 18.35,42.34 18.29,42.27 ; v3(49.35,59.48) 49.35,60.03 49.85,60.53 49.65,60.53 v3(48.75,61.43) ; R2.1 10.21,17.73 v3(10.96,16.98) 10.46,16.48 R4.1 ; v1(53,14.98) 53.25,15.23 U17.2 ; v3(58.45,58.87) 58.45,60.53 ; C1.1 18.63,14.36 v3(19.55,15.28)
  Top Layer w0.201: 29.85,49.88 C72.1 28.6,48.99 C71.1 28.91,49.28 v3(29.25,49.28) 29.85,49.88 ; 29.85,49.88 29.86,49.88
  Top Layer w0.25: v2(38.1,27.38) 37.2,26.48 R50.1 R49.1
  Top Layer w0.254: R10.2 27.54,38.16 27.76,38.39 26.8,39.35 R62.2 ; v1(13.86,47.93) D2.8 ; v2(2.97,33.23) 2.97,36.18 J2.10 ; v2(2.97,33.23) 4.11,32.1 J2.11 ; v2(2.97,33.23) v2(8.89,33.23) ; v3(23,59.48) v3(23,57.48) 22,56.48 v3(20,56.48) v3(18,56.48) ; C74.1 16.15,50.93 ; 1.69,24.05 1.69,23.44 ; 14.59,47.93 D2.3 v1(16.15,47.93) C73.1 ; C78.1 16.15,49.43 ; v1(13.86,50.93) D3.3 v1(16.15,50.93) ; C4.2 9.93,21.48 v1(10.76,22.3) 11.1,21.96 C41.1 ; C4.2 9.42,21.51 ; C4.2 9.05,21.08 v3(8.4,21.08) ; v2(7.95,64.58) Locate_Led1.2 ; 59.45,56.96 U9.2 v3(59.45,55.27)
  Top Layer w0.3: v3(20.55,15.28) 21.94,13.89 v2(22.1,13.89) ; v3(20.55,15.28) v3(20.55,16.28) 21.84,16.28 R7.1 ; v3(20.55,15.28) v3(19.55,15.28) 19.7,15.43 C87.1 ; 44.95,24.43 v3(44.95,23.01) ; C87.1 19.54,18.23 v3(18.03,19.73) ; C87.1 C88.1 ; v3(12.1,58.17) 12.1,56.86 12.1,56.85 ; R54.1 42.85,14.78 v2(44.85,14.78) ; 39.55,40.75 39.56,40.75 39.87,41.06 ; C58.1 38.28,41.51 38.27,41.51 ; v3(31.47,46.78) 30.59,46.78 ; 31.75,63.98 v3(31.75,64.98) ; U11.6 31.55,16.92 v3(30.9,16.28) ; U18.2 v3(24.7,19.11) ; 36.6,42.7 v1(36.53,42.63) ; v1(51.4,46.15) 50.99,46.56 50.83,46.56 ; C20.1 13.97,56.76 v3(13.97,58.07) ; R45.1 61.89,48.99 v2(61.59,48.69) v2(61.59,47.89) ; C91.1 28.42,17.45 v3(28.42,16.17) ; 40.72,39.63 39.69,38.59 39.68,38.59 ; 42.2,65.48 42.49,65.48 42.8,65.78 ; C92.1 30.17,16.51 v3(29.82,16.17) ; U11.8 v3(30.9,14.38)
  Top Layer w0.508: U8.1 17.21,24.95 v2(16.17,25.99)
  Top Layer w0.6: v2(57.91,7.03) 58.93,6.02 U12.B13 ; U12.A4 v2(47.83,7.16) ; v2(61.42,6.78) 61.9,6.29 U12.B16 ; U12.B7 v2(50.8,7.16) ; v2(63.88,6.78) U12.A18
  GND w0.155: v3(58.45,55.27) v3(59.45,55.27) v3(60.45,55.27) ; v2(54,48.53) 54,52.32 v3(55.3,53.62) ; v1(51.06,50.2) 51.06,51.65 v1(51.16,51.75)
  Bottom Layer w0.6: v2(61.42,6.78) 60.91,6.28 U12.A15 ; U12.A4 v2(47.83,7.16) ; v2(57.91,7.03) 57.94,7.01 U12.A12 ; v2(63.88,6.78) U12.A18
  vias: v3(12.9,53.63) v3(13.8,19.98) v3(15.3,18.48) v3(19.55,16.28) v3(21.5,50.18) v3(21.5,49.18) v3(21.5,48.18) v3(22.5,50.18) v3(22.5,49.18) v3(22.5,48.18) v3(23.5,50.18) v3(23.5,49.18) v3(23.5,48.18) v3(29.12,16.17) v3(29.85,49.88) v3(33.67,60.13) v3(37,62.98) v3(42.06,49.63) v3(42.06,48.63) v3(42.06,47.63) v3(42.15,65.48) v3(43.06,49.63) v3(43.06,48.63) v3(43.06,47.63) v3(44.06,49.63) v3(44.06,48.63) v3(44.06,47.63) v3(44.7,61.98) v3(49.65,63.98) v3(54.13,63.99) v1(16.15,49.43) v1(32.52,35.66) v1(34.47,14.23) v1(35.52,22.17) v1(36.27,20.22) v1(36.53,41.9) v1(36.53,41.21) v1(38.06,34.91) v1(38.21,41.44) v1(39.5,40.69) v1(39.62,38.53) v1(40.16,35.06) v1(41.81,36.41) v1(43.31,38.05) v1(43.82,40.69) v1(59.64,47.05) v2(6.68,40.72) v2(10.06,40.94) v2(14.43,40.97) v2(19.21,38.23) v2(20.8,36.38) v2(24.29,26.77) v2(27.45,26.18) v2(27.75,38.33) v2(30.89,30.28) v2(30.89,29.26) v2(45.1,9.57) v2(47.83,8.71) v2(50.8,8.71) v2(51.75,11.93) v2(53.25,12.53) v2(56.1,42.41) v2(56.1,37.33) v2(56.1,29.71) v2(56.1,24.63) v2(57.91,8.59) v2(58.41,12.53) v2(59.1,11.33) v2(61.5,42.41) v2(61.5,37.33) v2(61.5,29.71) v2(61.5,24.63) v2(62.39,48.69) v2(62.39,47.89) v2(63.88,15.8) v2(63.88,8.33)
VCC_HP: length 32.3
  Top Layer w0.127: 50.78,41.33 49.1,41.33 48.6,41.83 47.5,41.83 46.73,42.6 U13.76
  Top Layer w0.155: 39.03,42.49 C58.2 ; 39.03,42.49 39.03,42.7 ; 39.03,42.49 38.81,42.71 v1(38.81,42.93) ; 49.36,48.75 49.21,48.75 48.91,48.45 U13.91 ; 49.36,48.75 49.72,48.39 51.55,48.39 v2(51.85,48.69) ; 49.36,48.75 C56.2 ; v1(38.81,42.93) 38.81,43.02 39.03,43.25 ; v1(38.81,42.93) 39.03,42.7 ; 39.03,42.98 39.03,42.7 ; 39.03,42.98 38.97,42.93 ; 39.03,42.98 39.03,43.25 ; 38.79,57.64 38.99,57.44 38.99,56.14 C57.2 38.35,54.4 38.68,54.08 U13.26 ; 39.03,43.25 U13.54 ; R44.2 61.8,56.03
  Top Layer w0.254: 62.25,56.03 62.89,55.39 62.89,52.89 ; 62.25,56.03 v1(61.2,56.03) ; 62.25,56.03 62.22,56.06 R44.2
  VCC1 w0.254: 61.24,56.05 60.96,56.33 53.4,56.33 52.35,57.38 v3(52.35,58.18)
  vias: v1(38.85,57.68) v1(50.8,41.32) v3(51.35,59.18) v3(51.35,58.18) v3(52.35,59.18)
CH343P0_USB_D+: length 21.6
  Top Layer w0.155: U1.7 13.55,21.96 13.48,22.03 13.48,22.33 12.33,23.48 11.55,23.48 10.65,24.38 7.05,24.38 6.45,23.77 4.44,23.77 3.7,23.04 3.7,20.1 5.29,18.5 5.8,18.5 5.87,18.43 5.97,18.43 ; 5.97,18.43 5.71,18.17 5.71,17.69 5.97,17.43 USB2.B6 ; 5.97,18.43 USB2.A6 5.97,18.43
CH343P0_USB_D-: length 21.5
  Top Layer w0.155: U1.8 13.05,21.96 13.12,22.03 13.12,22.18 12.18,23.12 11.4,23.12 10.5,24.02 7.2,24.02 6.6,23.42 4.59,23.42 4.06,22.89 4.06,22.32 arc(4.12,22.17) 4.26,22.11 4.3,22.11 arc(4.5,21.91) 4.3,21.71 4.26,21.71 arc(4.06,21.5) 4.26,21.3 4.3,21.3 arc(4.5,21.1) 4.3,20.89 4.26,20.89 arc(4.12,20.83) 4.06,20.69 4.06,20.24 4.48,19.82 arc(4.62,19.77) 4.76,19.82 4.8,19.87 arc(5.09,19.87) 5.09,19.58 5.05,19.54 arc(4.99,19.39) 5.05,19.25 5.44,18.86 5.8,18.86 5.87,18.93 USB2.B7 7.53,18.93 7.8,18.67 7.8,18.19 7.53,17.93 USB2.A7
CH343P0_USB_DTR: length 3.2
  Top Layer w0.155: U2.1 12.05,16.67 12.55,17.17 U2.5 12.55,19.03 U1.12
CH343P0_USB_RTS: length 2.4
  Top Layer w0.155: 13.05,17.6 13.05,17.16 12.55,16.66 12.55,16.32 ; U1.13 U2.4
CH343P0_USB_RXD: length 45
  Top Layer w0.127: 16.89,22.15 17.35,22.15 17.43,22.24 17.43,22.66 19.61,24.83 29.1,24.83 32.32,28.05 32.32,34.41 33.74,35.83 39.8,35.83 43.95,39.98 43.95,40.18 44.45,40.68 44.45,42.97 44.28,43.14 U13.69
  Top Layer w0.155: U1.5 15.27,22.15 16.89,22.15
CH343P0_USB_TXD: length 45.3
  Top Layer w0.127: U13.70 44.63,43.17 44.7,43.11 44.7,40.58 44.2,40.08 44.2,39.74 39.91,35.45 33.9,35.45 32.7,34.25 32.7,27.88 29.26,24.43 19.86,24.43 17.68,22.26 17.68,21.24 17.45,21 16.64,21
  Top Layer w0.155: U1.4 15.35,20.73 15.62,21 16.64,21
CHIP_PU: length 76.8
  Top Layer w0.127: 48.06,52.65 48.54,52.65 49.28,53.39 v1(50.17,53.39)
  Top Layer w0.155: U2.3 13.05,16.58 13.44,16.97 v1(14.85,16.97) 15.31,16.51 R1.2 C1.2
  Bottom Layer w0.15: v1(14.85,16.97) 28.44,16.97 34.25,22.78 34.25,36.88 32.45,38.69 32.45,45.34 40.59,53.48 44.46,53.48 45.75,54.77 45.75,55.73 46.2,56.18 47.85,56.18 50.17,53.86 v1(50.17,53.39)
CSI_REXT: length 2
  Top Layer w0.155: R30.2 36.75,46.02 37.12,45.65 38.06,45.65
DM_HID: length 27
  Top Layer w0.155: v1(39.26,44.52) 39.26,44.17 39.38,44.05 39.38,43.63 U13.55
  Bottom Layer w0.155: v1(39.26,44.52) 39.26,44.88 39.38,45 39.38,45.87 40.55,47.05 53.65,47.05 55.36,45.34 55.36,40.74 56.05,40.05 56.44,40.05 H3.20
DM_MS: length 13.3
  Top Layer w0.155: U6.5 26.65,48.43 26.73,48.36 31.72,48.36 34.78,45.3 38.05,45.3
DP_HID: length 27.1
  Top Layer w0.155: v1(39.86,44.52) 39.86,44.17 39.74,44.05 39.74,43.63 U13.56
  Bottom Layer w0.155: H3.18 56.44,39.69 55.9,39.69 55,40.59 55,45.19 53.5,46.69 40.7,46.69 40.48,46.47 arc(40.42,46.32) 40.48,46.18 40.57,46.09 arc(40.57,45.81) 40.28,45.81 40.2,45.89 arc(40.05,45.95) 39.91,45.89 39.74,45.72 39.74,45 39.86,44.88 v1(39.86,44.52)
DP_MS: length 13.3
  Top Layer w0.155: U6.4 26.65,47.93 26.73,48 31.57,48 34.62,44.95 38.05,44.95
DSI_REXT: length 2.5
  Top Layer w0.15: U13.34 37.42,50.55 36.32,49.45 36.06,49.45
EMMC_CLK: length 28.5
  Top Layer w0.15: U13.84 50.68,46 51,45.68 ; CARD1.5 46.2,33.23 v1(46.35,33.38)
  Bottom Layer w0.15: 51,45.68 51,44.75 52.15,43.6 52.15,37.06 50.12,35.03 48,35.03 v1(46.35,33.38)
  vias: v1(50.95,45.7)
EMMC_CMD: length 32.7
  Top Layer w0.15: v1(49.75,33.38) 48.4,32.03 CARD1.3 ; v1(54.4,45.1) 53.8,45.7 52.6,45.7 51.12,47.18 49.38,47.18 48.9,46.7 U13.86
  Top Layer w0.155: R14.2 v1(49.75,33.38)
  Bottom Layer w0.15: v1(49.75,33.38) 49.75,34.02 52.6,36.87 52.6,44.05 53.65,45.1 v1(54.4,45.1)
EMMC_D0: length 29.7
  Top Layer w0.15: U13.80 49.43,44.6 50,44.03 v1(51,44.03) ; CARD1.7 44,32.53 v1(44.85,33.38)
  Top Layer w0.155: R16.2 v1(44.85,33.38)
  Bottom Layer w0.15: v1(44.85,33.38) 45.6,33.38 47.7,35.48 49.94,35.48 51.7,37.24 51.7,43.33 v1(51,44.03)
EMMC_D1: length 30.3
  Top Layer w0.102: v1(50.19,44.48) 50.25,44.48
  Top Layer w0.15: CARD1.8 42.9,32.93 v1(43.35,33.38) ; U13.81 49.71,44.95 v1(50.19,44.48)
  Top Layer w0.155: R17.2 v1(43.35,33.38)
  Bottom Layer w0.15: v1(50.19,44.48) 50.19,44.07 51.25,43 51.25,37.43 49.75,35.93 47.4,35.93 45.45,33.98 43.95,33.98 v1(43.35,33.38)
EMMC_D2: length 29.9
  Top Layer w0.15: v1(53.95,43.9) 52.9,44.95 50.35,44.95 50,45.3 U13.82 ; v1(52.75,33.38) 50.6,31.23 50.6,24.43
  Top Layer w0.155: R12.2 v1(52.75,33.38)
  Bottom Layer w0.15: v1(52.75,33.38) 51.74,34.39 51.74,34.74 53.5,36.5 53.5,43.45 v1(53.95,43.9)
EMMC_D3: length 30.1
  Top Layer w0.15: v1(51.25,33.38) 49.5,31.63 CARD1.2 ; 48.06,45.65 50.13,45.65 50.53,45.25 53.35,45.25 v1(53.95,44.65)
  Top Layer w0.155: R13.2 v1(51.25,33.38)
  Bottom Layer w0.15: v1(53.95,44.65) 53.05,43.75 53.05,36.68 51.25,34.88 v1(51.25,33.38)
ESP32P4_EN_DCDC: length 25.4
  Top Layer w0.119: U9.1 61.21,57.39 v1(61.29,57.39) ; 55.9,45.25 55.9,44.95 54.25,43.3 51.98,43.3 51.68,43.6 49.29,43.6 48.63,44.25 U13.79
  Bottom Layer w0.119: v1(61.29,57.39) 62.04,56.64 62.04,51.39 55.9,45.25
  vias: v1(55.95,45.23)
ESP32P4_FB_DCDC: length 27.7
  Top Layer w0.119: 47.43,43.63 48.37,43.63 48.72,43.28 51.55,43.28 51.85,42.98 54.38,42.98 56.83,45.43 61.47,45.43 61.59,45.55
  Top Layer w0.127: R45.2 62.19,51.25 63.24,50.19 63.24,47.2 61.59,45.55
  Top Layer w0.254: 61.79,52.89 61.79,51.35 R45.2 ; U9.5 60.87,53.97 61.83,53.01 R44.1
ETH_INT_PWDN: length 28.2
  Top Layer w0.15: R42.1 25.73,37.26 v1(25.73,36.78) 25.2,36.25 25.2,35.47
  Top Layer w0.155: v1(38.86,54.91) 39.03,54.74 U13.25
  Bottom Layer w0.15: v1(38.86,54.91) 38.65,55.13 37.47,55.13 29.08,46.74 29.08,43.44 25.58,39.94 25.58,36.93 v1(25.73,36.78)
ETH_LED_GPIO15: length 45.4
  Top Layer w0.15: v1(42.75,55.58) 42.75,54.83 42.18,54.26 U13.16 ; R9.1 v1(26.18,25.96)
  Bottom Layer w0.15: v1(26.18,25.96) 27.3,27.08 31.5,27.08 33.85,29.43 33.85,36.72 32.05,38.52 32.05,45.5 40.42,53.88 41.95,53.88 42.75,54.68 v1(42.75,55.58)
ETH_RST_N: length 33.3
  Top Layer w0.127: v1(39.62,57.07) 39.38,56.83 U13.24
  Top Layer w0.15: U19.5 24.3,36.17 24.25,36.22 ; C98.2 v1(24.12,36.87) R41.1
  Bottom Layer w0.15: v1(24.12,36.87) 24.44,37.19 24.44,40.42 27.94,43.92 27.94,47.22 36.99,56.27 38.82,56.27 v1(39.62,57.07)
GPIO0: length 61.2
  Top Layer w0.15: 49.21,54.02 49.08,54.02 U13.104 ; v1(46.2,19.28) 46.2,18.98 43.53,16.3 41.47,16.3 R54.2 39.55,14.38 U11.9
  Bottom Layer w0.15: 36.62,26.48 36.65,26.44 ; 36.65,26.44 43.4,19.7 45.78,19.7 v1(46.2,19.28) ; 36.65,26.44 36.65,37.88 34.85,39.68 34.85,44.34 41.58,51.08 46.2,51.08 v1(49.2,54.08)
GPIO1: length 59.2
  Top Layer w0.15: 47.43,53.63 47.7,53.63 v1(48.45,54.38) ; v1(45.3,19.13) 45.3,18.68 43.27,16.65 41.47,16.65 R52.2 40.09,16.92 U11.11
  Bottom Layer w0.15: v1(48.45,54.38) 48.18,54.38 45.28,51.48 41.42,51.48 34.45,44.51 34.45,39.51 36.25,37.71 36.25,26.28 43.4,19.13 v1(45.3,19.13)
GPIO2: length 65.7
  Top Layer w0.15: U13.2 47.08,54.36 47.8,55.07 v1(48.08,55.07)
  Bottom Layer w0.15: v1(48.08,55.07) 48.08,54.83 45.12,51.88 41.25,51.88 34.05,44.67 34.05,39.35 35.85,37.54 35.85,25.74 42.96,18.64 55.35,18.64 H3.4
GPIO3: length 66.7
  Top Layer w0.127: 46.73,53.63 46.73,54.75 v1(47.59,55.61)
  Bottom Layer w0.15: v1(47.59,55.61) 47.59,54.91 44.95,52.28 41.09,52.28 33.65,44.84 33.65,39.18 35.45,37.38 35.45,25.58 42.79,18.24 57.49,18.24 ; 57.18,17.93 57.49,18.24 ; 57.49,18.24 H3.2
GPIO4: length 46.2
  Top Layer w0.15: v1(46.95,55.61) 46.38,55.04 U13.4 ; U11.1 35.25,23.27
  Bottom Layer w0.15: v1(46.95,55.61) 46.95,54.84 44.79,52.68 40.92,52.68 33.25,45.01 33.25,39.02 35.05,37.21 35.05,23.47 35.25,23.27
  vias: v1(35.25,23.33)
GPIO5: length 48.3
  Top Layer w0.15: U11.3 34.65,20.73 35.25,21.33 ; v1(46.31,55.61) 46.03,55.33 U13.5
  Bottom Layer w0.15: 35.25,21.33 35.25,21.53 34.65,22.12 34.65,37.05 32.85,38.85 32.85,45.17 40.76,53.08 44.62,53.08 46.31,54.77 v1(46.31,55.61)
  vias: v1(35.25,21.38)
GPIO16: length 20.2
  Top Layer w0.15: U5.5 32.9,61.43 v2(33.45,61.43) 34.2,60.68 34.2,59.33 33.3,58.43 R35.1 ; v1(41.1,59.48) 41.1,57.38 42.21,56.27 42.21,54.85 41.83,54.48 U13.17
  VCC w0.15: v2(33.45,61.43) 33.75,61.43 35.25,59.93 40.65,59.93 v1(41.1,59.48)
GPIO17: length 33.6
  Top Layer w0.15: R48.1 14.85,64.58 v1(15.3,64.13) ; v1(41.7,55.73) 41.7,54.96 41.48,54.74 U13.18
  VCC w0.15: v1(41.7,55.73) 41.48,55.51 37.42,55.51 32.7,60.23 26.1,60.23 22.2,64.13 v1(15.3,64.13)
GPIO36: length 9.4
  Top Layer w0.127: U13.68 43.93,42.83 v1(44.02,42.74)
  Top Layer w0.15: R26.1 51.45,42.08 v1(50.7,42.83)
  Bottom Layer w0.127: 50.65,42.78 50.65,42.57 50.42,42.34 44.42,42.34 v1(44.02,42.74)
GPIO50: length 53.8
  Top Layer w0.15: U17.4 51.85,16.43 48.55,19.73 v1(47.55,19.73) ; U13.93 48.63,49.15 48.75,49.03
  Bottom Layer w0.15: v1(47.55,19.73) 46.56,20.71 43.82,20.71 37.45,27.08 37.45,38.21 35.65,40.01 35.65,44.01 41.92,50.28 47,50.28 48.25,49.03 48.75,49.03
  vias: v1(48.75,48.98)
GPIO51: length 60.1
  Top Layer w0.127: U13.94 51.34,49.5 v1(51.4,49.44)
  Top Layer w0.15: v1(47.25,19.13) 48.55,19.13 51.55,16.13 51.55,15.73
  Bottom Layer w0.15: v1(47.25,19.13) 46.06,20.31 43.65,20.31 37.05,26.91 37.05,38.04 35.25,39.85 35.25,44.18 41.75,50.68 47.2,50.68 48.43,49.44 v1(51.4,49.44)
HDMI_0N-: length 9.7
  Top Layer w0.119: D3.2 15.84,50.43 15.93,50.34 18.29,50.34 18.38,50.43 U6.28 ; D3.9 14.16,50.43 14.07,50.34 11.32,50.34 10.98,50.68 HDMI1.9
  Top Layer w0.124: 15.44,50.42 14.56,50.42
HDMI_0P+: length 9.7
  Top Layer w0.119: U6.29 18.38,49.93 18.29,50.02 15.93,50.02 15.84,49.93 D3.1 ; D3.10 14.16,49.93 14.07,50.02 11.32,50.02 10.98,49.68 HDMI1.7
  Top Layer w0.124: 14.56,49.92 15.44,49.92
HDMI_1N-: length 9.7
  Top Layer w0.119: HDMI1.6 10.98,49.18 11.32,48.84 14.07,48.84 14.16,48.93 D2.6 D2.5 15.84,48.93 15.93,48.84 18.29,48.84 18.38,48.93 U6.31
HDMI_1P+: length 9.7
  Top Layer w0.119: HDMI1.4 10.98,48.18 11.32,48.52 14.07,48.52 14.16,48.43 D2.7 D2.4 15.84,48.43 15.93,48.52 18.29,48.52 18.38,48.43 U6.32
HDMI_2N-: length 9.7
  Top Layer w0.119: HDMI1.3 10.98,47.68 11.32,47.34 14.07,47.34 14.16,47.43 D2.9 D2.2 15.84,47.43 15.93,47.34 18.29,47.34 18.38,47.43 U6.34
HDMI_2P+: length 9.7
  Top Layer w0.119: U6.35 18.38,46.93 18.29,47.02 15.93,47.02 15.84,46.93 D2.1 D2.10 14.16,46.93 14.07,47.02 11.32,47.02 10.98,46.68 HDMI1.1
HDMI_5V: length 16.9
  Top Layer w0.3: R40.1 11.84,61.87 R38.1 10.15,61.87 R39.1 11.63,58.88 14.25,58.88 15,58.13 15,56.03 14.33,55.36 C20.2 11.48,55.36 11.3,55.18 HDMI1.18
HDMI_CN-: length 9.7
  Top Layer w0.119: HDMI1.12 10.98,52.18 11.32,51.84 14.07,51.84 14.16,51.93 D3.6 D3.5 15.84,51.93 15.93,51.84 18.29,51.84 18.38,51.93 U6.25
HDMI_CP+: length 9.7
  Top Layer w0.119: U6.26 18.38,51.43 18.29,51.52 15.93,51.52 15.84,51.43 D3.4 D3.7 14.16,51.43 14.07,51.52 11.32,51.52 10.98,51.18 HDMI1.10
HDMIDET: length 15.6
  Top Layer w0.127: v1(22.95,56.33) 22.75,56.13 U6.18
  Top Layer w0.3: R40.2 13.65,61.88 v3(14.55,60.98)
  Bottom Layer w0.254: v1(22.95,56.33) 22.65,56.33 17.95,61.03 14.58,61.03
HDMIHPD: length 17.6
  Top Layer w0.127: U6.17 23.25,55.67 v1(23.24,55.67)
  Top Layer w0.254: HDMI1.19 9.56,56.06 v1(10.06,56.56)
  Bottom Layer w0.127: v1(23.24,55.67) 20.32,55.67 20.07,55.93 10.7,55.93 v1(10.06,56.56)
HDMISCL: length 30.7
  Top Layer w0.15: R38.2 5.7,58.92 v2(5.7,54.98) 7,53.68 9.76,53.68
  Top Layer w0.2: U6.22 20.75,53.82 20.95,54.02 v1(20.95,54.53)
  Bottom Layer w0.127: v2(5.7,54.98) 6.4,55.67 19.81,55.67 v1(20.95,54.53)
HDMISDA: length 28.7
  Top Layer w0.15: R39.2 7.93,60.35 6.08,58.51 6.08,55.41 v2(7.32,54.18) 9.76,54.18
  Top Layer w0.2: U6.21 21.25,53.81 v1(21.46,54.02)
  Bottom Layer w0.127: v1(21.46,54.02) 20.75,54.02 19.35,55.43 7.05,55.43 6.75,55.13 6.75,54.74 v2(7.32,54.18)
HXIN: length 8.4
  Top Layer w0.127: 25.99,46.43 28.42,46.43 29.08,45.77 29.08,44.3 X3.1
  Top Layer w0.155: X3.1 27.59,42.81 C17.1
HXOUT: length 8.2
  Top Layer w0.127: 29.82,45.49 29.82,45.16 ; 29.82,45.16 29.94,45.04 X3.3 28.44,46.93 U6.2 ; 29.82,45.16 29.82,44.79
  Top Layer w0.155: X3.3 30.71,45.43 C18.1
LED_MS: length 1.6
  Top Layer w0.2: U6.39 20.75,44.58 MS_LED1.1
MDC: length 35
  Top Layer w0.15: v1(25.8,32.03) 25.7,32.13 U19.16
  Top Layer w0.155: v1(40.26,56.06) 40.08,55.88 U13.22
  Bottom Layer w0.15: v1(25.8,32.03) 25.2,32.63 25.2,40.1 28.7,43.6 28.7,46.9 37.31,55.51 39.71,55.51 v1(40.26,56.06)
MDIO: length 37.3
  Top Layer w0.127: 39.73,53.63 39.73,56.29 v1(40.13,56.69)
  Top Layer w0.15: U19.15 v1(25.2,31.94) 25.2,31.66 R11.1
  Bottom Layer w0.15: v1(40.13,56.69) 39.33,55.89 37.15,55.89 28.32,47.06 28.32,43.76 24.82,40.26 24.82,32.32 v1(25.2,31.94)
MS_SCL: length 103.7
  Top Layer w0.15: R31.1 54.42,45.98 61.2,45.98 v1(61.5,46.28)
  Top Layer w0.155: 32.7,63.98 v2(32.7,64.98)
  Top Layer w0.254: R36.1 26.23,56.79 v2(25.48,56.79) 25.63,56.64 25.63,55.4 25.25,55.03 U6.13
  VCC w0.15: H3.1 61.07,19.28 61.8,19.28 63.45,20.93 63.45,43.73 61.5,45.68 v1(61.5,46.28) 62.25,46.28 63.45,47.48 63.45,57.23 59.85,60.83 35.55,60.83 32.7,63.68 v2(32.7,64.98)
  Bottom Layer w0.155: v2(25.48,56.79) 25.48,58.16 30.69,63.38 31.95,63.38 32.7,64.13 v2(32.7,64.98)
MS_SDA: length 102.5
  Top Layer w0.15: R61.1 55.03,46.58 v1(60.9,46.58)
  Top Layer w0.155: 30.8,63.98 v2(30.8,64.98)
  Top Layer w0.254: U6.14 24.75,55.43 25.05,55.73 25.05,56.16 v2(24.58,56.64) 24.58,57.27 25,57.69
  VCC w0.15: H3.3 61.19,19.7 61.62,19.7 63,21.08 63,43.43 60.9,45.53 v1(60.9,46.58) 61.2,46.88 62.23,46.88 63,47.65 63,57.08 59.71,60.37 35.4,60.37 v2(30.8,64.98)
  Bottom Layer w0.155: v2(24.58,56.64) 24.58,57.9 30.8,64.12 v2(30.8,64.98)
P4_FLASH_CK: length 10.7
  Top Layer w0.15: U22.6 36.36,59.87 35.8,59.3 35.8,54.21 34.3,52.71 34.3,51.43 35.01,50.72 R28.1
P4_FLASH_CS: length 17.3
  Top Layer w0.15: v1(38.25,57.68) 38.25,57.38 37.8,56.93 37.8,53.17 37.97,53 U13.27 ; U22.1 v1(38.9,65.08) 39.1,65.08 39.45,64.73 39.45,62.91 R25.2
  Bottom Layer w0.15: v1(38.9,65.08) 38.9,58.63 38.25,57.98 v1(38.25,57.68)
P4_FLASH_D: length 14.7
  Top Layer w0.15: U22.5 35.1,58.88 35.4,58.58 35.4,54.38 33.9,52.88 33.9,50.99 34.8,50.09 36.45,50.09 37.26,50.9 U13.33
P4_FLASH_HOLD: length 13.2
  Top Layer w0.15: U13.31 36.69,51.6 36.45,51.36 34.97,51.36 34.7,51.63 34.7,52.55 36.2,54.05 36.2,58.64 U22.7
P4_FLASH_Q: length 14.6
  Top Layer w0.15: v1(37.7,58.15) 37.7,57.43 37.4,57.13 37.4,52.83 37.58,52.65 38.06,52.65 ; U22.2 v1(37.64,65.08)
  Bottom Layer w0.15: v1(37.64,65.08) 38.51,64.21 38.51,58.96 v1(37.7,58.15)
P4_FLASH_WP: length 15.9
  Top Layer w0.15: v1(37.2,57.68) 37,57.48 37,52.63 37.33,52.3 U13.29 ; U22.3 v1(36.36,65.08)
  Bottom Layer w0.15: v1(37.2,57.68) 37.2,58.32 38.11,59.23 38.11,63.82 36.85,65.08 v1(36.36,65.08)
P4_VDDO1_FLASH: length 41.4
  Top Layer w0.127: 44.98,40.92 44.98,39.95 C59.2 45.11,39.97 ; 44.98,40.92 v1(45.21,40.69) ; 44.98,40.92 U13.71 ; v1(45.21,40.69) 45.21,40.08 45.11,39.97 ; v1(45.21,40.69) 45.11,40.58 45.11,39.97
  Top Layer w0.15: U22.8 39.97,61.14 R25.1
  Top Layer w0.155: 38.06,51.95 36.78,51.95 v2(36.6,52.13)
  Top Layer w0.2: U22.8 38.88,60.05 C14.1 37.65,58.88 36.6,57.83 v2(36.6,52.13)
  Top Layer w0.3: v2(36.6,52.13) C60.2
  VCC1 w0.254: 45.41,40.6 45.41,42.85 38.21,50.04 38.21,52.74 36.72,54.24 36.72,58.29 37.2,58.77 v1(37.2,59.03)
  vias: v1(36.75,58.58)
P4_VDDO2_PSRAM: length 14
  Top Layer w0.127: U13.72 45.33,44 45.05,44.28 43.58,44.28 ; 43.58,44.28 41.06,44.28 40.78,44.01 U13.59 ; 43.58,44.28 U13.67 43.58,42.36 C63.2
  Top Layer w0.15: U13.72 45.33,41.33 46.03,40.63 C61.2 ; U13.59 40.78,41.97 C62.2
P4_VDDO3_MIPI: length 29.1
  Top Layer w0.127: U13.73 45.68,44.11 46.2,44.63 46.95,44.63 47.06,44.73 47.06,52.52 46.95,52.62 39.16,52.62 39.06,52.52 39.06,48.38 38.78,48.1 U13.41
  Top Layer w0.15: C64.2 47.03,40.14 45.68,41.49 U13.73
  Top Layer w0.155: C65.2 U13.41
